# Altium project EMG-Arm_ELC-v1.0.PrjPcb (part 6 of 9)

## Sheet Electrode-Sheet5.SchDoc
size A4; SheetNumber: 7; SheetTotal: 12
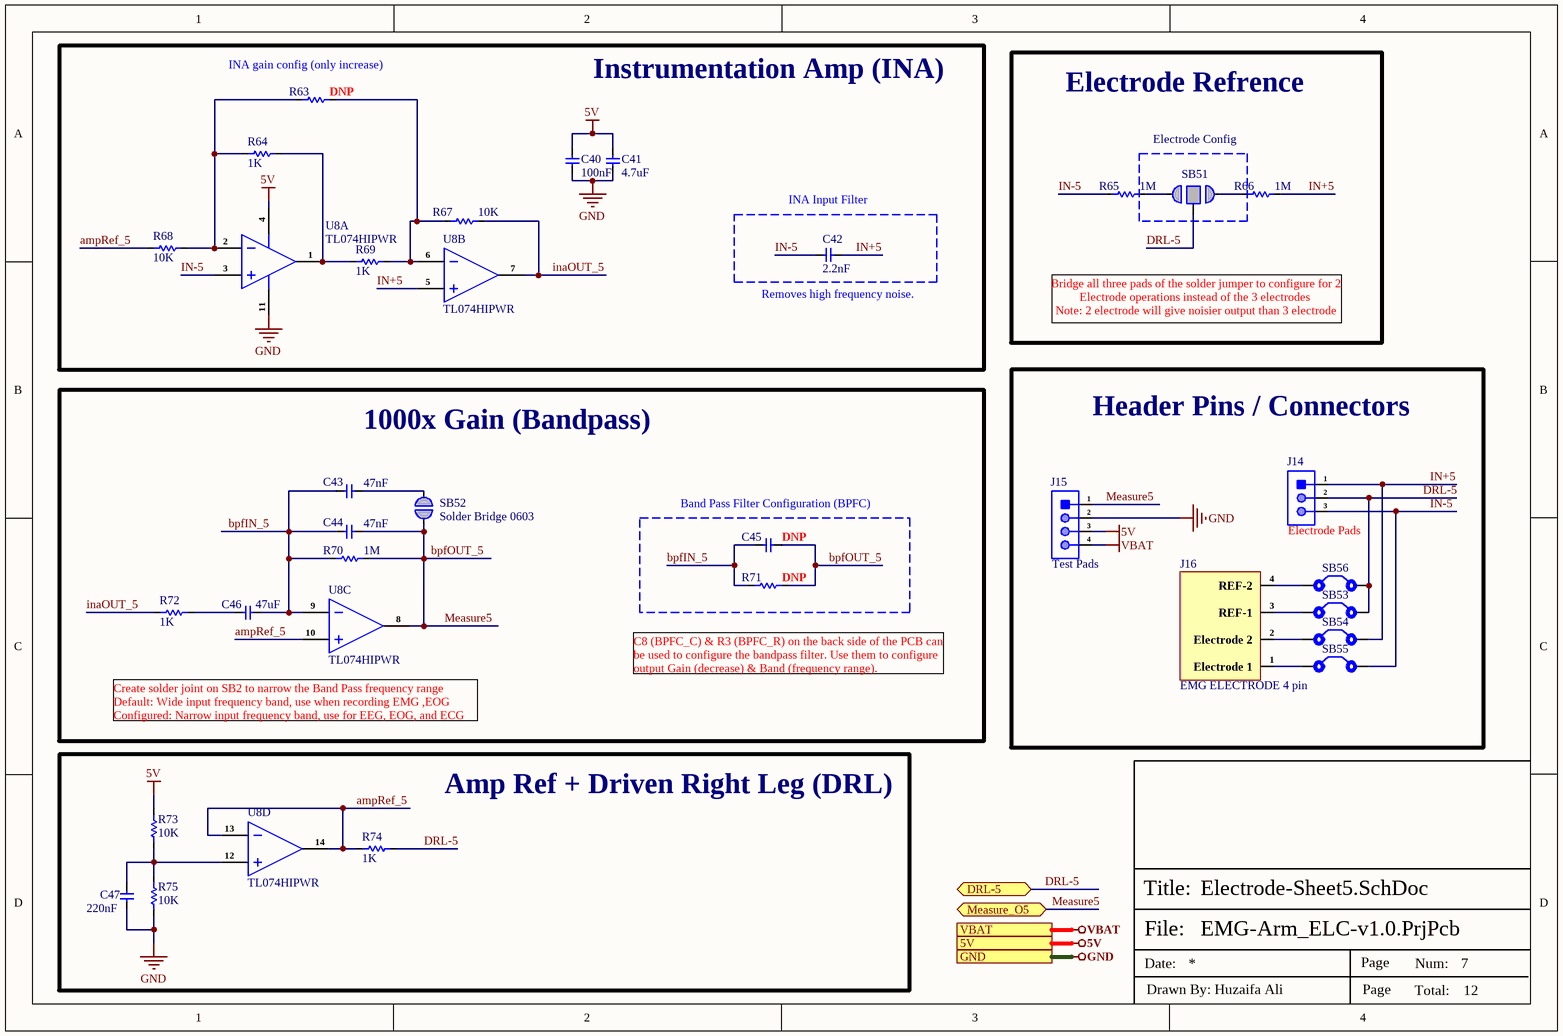
[diagram p8: Electrode-Sheet5.SchDoc]

### Parts
C40  100nF  [cap-0402]
C41  4.7uF  [Cap-0603]
C42  2.2nF  [Cap-0603]
C43  47nF  [Cap-0603]
C44  47nF  [Cap-0603]
C45  DNP  [Cap-0603]
C46  47uF  [Cap-0805]
C47  220nF  [Cap-0603]
J14  Test Pad SMD 3 Pin  [Test Pad (SMD 3 Pin)]  (value not drawn)  (no BOM)
J15  4 Pin SMD Wire Connector  [4 Pin SMD Wire CON.]  (value not drawn)  (no BOM)
J16  EMG ELECTRODE 4 pin  [EMG ELECTRODE 4 pin]  (no BOM)
R63  DNP  [Res-0603]
R64  1K  [Res-0402]
R65  1M  [Res-0402]
R66  1M  [Res-0402]
R67  10K  [Res-0402]
R68  10K  [Res-0402]
R69  1K  [Res-0402]
R70  1M  [Res-0603]
R71  DNP  [Res-0603]
R72  1K  [Res-0402]
R73  10K  [Res-0402]
R74  1K  [Res-0402]
R75  10K  [Res-0402]
SB51  Solder Bridge 3 Pin  [Solder Bridge 3 Pin]  (value not drawn)  (no BOM)
SB52  Solder Bridge 0603  [Solder Bridge]  (no BOM)
SB53  Solder Bridge 0603  [Solder Bridge]  (value not drawn)  (no BOM)
SB54  Solder Bridge 0603  [Solder Bridge]  (value not drawn)  (no BOM)
SB55  Solder Bridge 0603  [Solder Bridge]  (value not drawn)  (no BOM)
SB56  Solder Bridge 0603  [Solder Bridge]  (value not drawn)  (no BOM)
U8  TL074HIPWR  [TSSOP-14]  (parts A,B,C,D of 4)

### Blocks framed on the sheet
Instrumentation Amp (INA): C40 C41 R63 R64 R67-R69 U8
Electrode Refrence: R65 R66
Electrode Config: SB51
INA Input Filter: C42
1000x Gain (Bandpass): C43 C44 C46 R70 R72 SB52 U8
Header Pins / Connectors: J14-J16 SB53-SB56
Band Pass Filter Configuration (BPFC): C45 R71
Amp Ref + Driven Right Leg (DRL): C47 R73-R75 U8

### Ports
5V (see Top-Sheet[3C], Electrode-Sheet1[3D], Electrode-Sheet2[3D], Electrode-Sheet3[3D], Electrode-Sheet4[3D], Electrode-Sheet6[3D], Electrode-Sheet7[3D], Electrode-Sheet8[3D], Opamp-Sheet2[1D], Power-Sheet[1D]), DRL-5 (bidir, see Top-Sheet[4C], Electrode-Sheet1[3D], Electrode-Sheet2[3D], Electrode-Sheet3[3D], Electrode-Sheet4[3D], Electrode-Sheet6[3D], Electrode-Sheet7[3D], Electrode-Sheet8[3D]), GND (see Top-Sheet[3C], Connector-Sheet[1D], Electrode-Sheet1[3D], Electrode-Sheet2[3D], Electrode-Sheet3[3D], Electrode-Sheet4[3D], Electrode-Sheet6[3D], Electrode-Sheet7[3D], Electrode-Sheet8[3D], Opamp-Sheet2[1D], Power-Sheet[1D]), Measure_O5 (bidir, see Top-Sheet[3C]), VBAT (see Top-Sheet[3C], Connector-Sheet[1D], Electrode-Sheet1[3D], Electrode-Sheet2[3D], Electrode-Sheet3[3D], Electrode-Sheet4[3D], Electrode-Sheet6[3D], Electrode-Sheet7[3D], Electrode-Sheet8[3D], Power-Sheet[1D])

### Nets
5V: C40.2 C41.2 J15.3 R73.2 U8.4(VCC+) ; port 5V
GND: C40.1 C41.1 C47.1 J15.2 R75.1 U8.11(VCC-) ; port GND
VBAT: J15.4 ; port VBAT
ampRef_5: R68.2 R74.1 U8.10(3IN+) U8.13(4IN-) U8.14(4OUT)
bpfIN_5: C43.1 C44.1 C45.2 C46.2 R70.1 R71.1 U8.9(3IN-)
bpfOUT_5: C44.2 C45.1 J15.1 R70.2 R71.2 SB52.2 U8.8(3OUT) ; port Measure_O5  [also labelled Measure5]
DRL-5: J14.2 R74.2 SB51.2 SB53.2 SB56.2 ; port DRL-5
IN+5: C42.2 J14.1 R66.2 SB54.2 U8.5(2IN+)
IN-5: C42.1 J14.3 R65.1 SB55.2 U8.3(1IN+)
inaOUT_5: R67.1 R72.1 U8.7(2OUT)
NetC43_2: C43.2 SB52.1
NetC46_1: C46.1 R72.2
NetC47_2: C47.2 R73.1 R75.2 U8.12(4IN+)
NetJ16_1: J16.1(Electrode_1) SB55.1
NetJ16_2: J16.2(Electrode_2) SB54.1
NetJ16_3: J16.3(REF-1) SB53.1
NetJ16_4: J16.4(REF-2) SB56.1
NetR63_1: R63.1 R64.1 R68.1 U8.2(1IN-)
NetR63_2: R63.2 R67.2 R69.2 U8.6(2IN-)
NetR64_2: R64.2 R69.1 U8.1(1OUT)
NetR65_2: R65.2 SB51.1
NetR66_1: R66.1 SB51.3

### Notes on the sheet
- (near R63) INA gain config (only increase)
- (near C42) Removes high frequency noise.
- Bridge all three pads of the solder jumper to configure for 2 Electrode operations instead of the 3 electrodes
  Note: 2 electrode will give noisier output than 3 electrode
- (near J15) Test Pads
- (near J14) Electrode Pads
- (near U8) Create solder joint on SB2 to narrow the Band Pass frequency range
  Default: Wide input frequency band, use when recording EMG ,EOG
  Configured: Narrow input frequency band, use for EEG, EOG, and ECG
- (near R71) C8 (BPFC_C) & R3 (BPFC_R) on the back side of the PCB can be used to configure the bandpass filter. Use them to configure output Gain (decrease) & Band (frequency range).
- File:
- Title:
- Date:
- Page
- Num:
- Total:
- Drawn By: Huzaifa Ali

### Library data of the parts
C40 = C1005X7R1H104KT000F: CAP CER 0.1UF 50V X7R 0402; Manufacturer: TDK; Tolerance: 10%; Voltage: 25V; Item Type: Capacitor; Supplier 1: Avnet; Manufacturer Part Number: C1005X7R1H104KT000F; RoHS: No; Category: Ceramic Capacitors; Dielectric: X7R; Supplier Part Number 1: C1005X7R1H104KT000F; LCSC Part Number: C361198; ComponentLink1Description: LCSC; ComponentLink1URL: https://www.lcsc.com/product-detail/Multilayer-Ceramic-Capacitors-MLCC-SMD-SMT_TDK-C1005X7R1H104KT000F_C361198.html
C41 = C1608X5R1E475KT000E: CAP CER, 4.7 µF, 25 V, 0603; Manufacturer: TDK; Dielectric Material: Ceramic; Tolerance: 10%; Voltage Rating: 25V; Dielectric: X5R; Item Type: Capacitor; Supplier 1: Digi-Key; Manufacturer Part Number: C1608X5R1E475KT000E; RoHS: No; Supplier Part Number 1: 2220Y1000562GCT-ND; Supplier 2: RSComponents; Category: Ceramic Capacitors; Stock 2: 16120; Pricing 2: 100=0.23400, 200=0.21900, 1000=0.20700, 2000=0.18700 (GBP); Mount: Surface Mount; Case/Package: 0603; Weight: 7.1E-05oz; Case Code (Metric): 1608; Case Code (Imperial): 0603; Min Operating Temperature: -55°C; Max Operating Temperature: 85°C; Termination: SMD/SMT; Resistor Type: Ceramic; Packaging: Tape and Reel; Capacitance: 4.7uF; Package Quantity: 4000; Voltage Rating (DC): 25V; Length: 1.6mm; Width: 0.031inch; Height: 0.8mm; Thickness: 0.039inch; Depth: 0.8mm; Lead Free: Lead Free; REACH SVHC: No SVHC; ComponentLink1URL: https://datasheet.ciiva.com/48587/6print-detail-pdf-phplangenpart-noc1608x5r1e475k080acimp-unit-xmhz-48587141.pdf?src-supplier=Onlinecomponents.com; ComponentLink1Description: https://datasheet.ciiva.com/48587/6print-detail-pdf-phplangenpart-noc1608x5r1e475k080acimp-unit-xmhz-48587141.pdf?src-supplier=Onlinecomponents.com; ComponentLink2URL: https://datasheet.ciiva.com/24216/mlcc-commercial-general-en-24216326.pdf?src-supplier=Mouser; ComponentLink2Description: https://datasheet.ciiva.com/24216/mlcc-commercial-general-en-24216326.pdf?src-supplier=Mouser; ComponentLink3URL: https://datasheet.ciiva.com/48671/mlcc-commercial-general-en-48671304.pdf?src-supplier=Avnet; ComponentLink3Description: https://datasheet.ciiva.com/48671/mlcc-commercial-general-en-48671304.pdf?src-supplier=Avnet; Supplier Part Number 2: 9159158P; LCSC Part Number: C76615
C42 = CC0603KRX7R9BB222: CAP CER 2200PF 50V X7R 0603; Manufacturer: Yageo; Tolerance: 10%; Insulation Resistance: 10GR; Dissipation Factor: 2.5%; Item Type: Capacitor; Supplier 1: RSComponents; Manufacturer Part Number: CC0603KRX7R9BB222; RoHS: Yes; Category: Ceramic Capacitors; Stock 1: 1; Pricing 1: 4000=0.00500 (USD); Mount: Surface Mount; Case/Package: 0603; Number of Pins: 2; Case Code (Metric): 1608; Case Code (Imperial): 0603; Min Operating Temperature: -55°C; Max Operating Temperature: 125°C; Capacitance: 2.2nF; Dielectric: X7R; Package Quantity: 1; Voltage Rating: 50V; Packaging: Tape and Reel; Voltage Rating (DC): 50V; Termination: SMD/SMT; Resistor Type: Ceramic; Voltage: 50V; Series: CC; Length: 1.6mm; Width: 0.031inch; Height: 0.8mm; Thickness: 0.035inch; Depth: 0.8mm; Radiation Hardening: No; REACH SVHC: No SVHC; Lead Free: Lead Free; Halogen Free: Halogen Free; RoHS Compliant: Yes; ComponentLink1URL: https://datasheet.ciiva.com/23768/1079489-23768004.pdf?src-supplier=Newark; ComponentLink1Description: https://datasheet.ciiva.com/23768/1079489-23768004.pdf?src-supplier=Newark; ComponentLink2URL: https://datasheet.ciiva.com/11788/0900766b8079c870-11788403.pdf?src-supplier=RSComponents; ComponentLink2Description: https://datasheet.ciiva.com/11788/0900766b8079c870-11788403.pdf?src-supplier=RSComponents; ComponentLink3URL: https://datasheet.ciiva.com/26862/getdatasheetpartid-403587-26862854.pdf?src-supplier=Verical; ComponentLink3Description: https://datasheet.ciiva.com/26862/getdatasheetpartid-403587-26862854.pdf?src-supplier=Verical; ComponentLink4URL: https://datasheet.ciiva.com/8033/70765-8033863.pdf?src-supplier=Element14; ComponentLink4Description: https://datasheet.ciiva.com/8033/70765-8033863.pdf?src-supplier=Element14; ComponentLink5URL: https://datasheet.ciiva.com/7978/1489800-7978172.pdf?src-supplier=Element14; ComponentLink5Description: https://datasheet.ciiva.com/7978/1489800-7978172.pdf?src-supplier=Element14; ComponentLink6URL: https://datasheet.ciiva.com/28450/1489800-28450632.pdf?src-supplier=Element14; ComponentLink6Description: https://datasheet.ciiva.com/28450/1489800-28450632.pdf?src-supplier=Element14; ComponentLink7URL: https://datasheet.ciiva.com/155/mlccorderingcode-155921.pdf?src-supplier=Digi-Key; ComponentLink7Description: https://datasheet.ciiva.com/155/mlccorderingcode-155921.pdf?src-supplier=Digi-Key; ComponentLink8URL: https://datasheet.ciiva.com/155/mlccorderingcode-155920.pdf?src-supplier=Digi-Key; ComponentLink8Description: https://datasheet.ciiva.com/155/mlccorderingcode-155920.pdf?src-supplier=Digi-Key; ComponentLink9URL: https://datasheet.ciiva.com/155/mlccorderingcode-155922.pdf?src-supplier=Digi-Key; ComponentLink9Description: https://datasheet.ciiva.com/155/mlccorderingcode-155922.pdf?src-supplier=Digi-Key; ComponentLink10URL: https://datasheet.ciiva.com/8033/1489800-8033864.pdf?src-supplier=Element14; ComponentLink10Description: https://datasheet.ciiva.com/8033/1489800-8033864.pdf?src-supplier=Element14; ComponentLink11URL: https://datasheet.ciiva.com/8033/1489800-8033862.pdf?src-supplier=Element14; ComponentLink11Description: https://datasheet.ciiva.com/8033/1489800-8033862.pdf?src-supplier=Element14; ComponentLink12URL: https://datasheet.ciiva.com/16625/upy-gphc-x7r-6-3v-to-50v-8-16625531.pdf?src-supplier=Avnet+Europe; ComponentLink12Description: https://datasheet.ciiva.com/16625/upy-gphc-x7r-6-3v-to-50v-8-16625531.pdf?src-supplier=Avnet+Europe; Supplier Part Number 1: 6169509; LCSC Part Number: C107082
C43 C44 = CGA3E2X8R1H473M080AA: CAP CER 0.047UF 50V X8R 0603; Manufacturer: TDK; Tolerance: 20%; Item Type: Capacitor; Supplier 1: Digi-Key; Manufacturer Part Number: CGA3E2X8R1H473M080AA; RoHS: Yes; Category: Ceramic Capacitors; Stock 1: 1279; Pricing 1: 1=0.16000, 10=0.11200, 50=0.06360, 100=0.05260, 500=0.03690, 1000=0.03055 (USD); Mount: Surface Mount; Case/Package: 0603; Case Code (Metric): 1608; Weight: 7.1E-05oz; Case Code (Imperial): 0603; Min Operating Temperature: -55°C; Max Operating Temperature: 150°C; Dielectric: X8R; Voltage Rating (DC): 50V; Package Quantity: 4000; Packaging: Tape and Reel; Capacitance: 47nF; Voltage Rating: 50V; Features: High Temperature; Length: 0.063inch; Width: 0.031inch; Height: 0.8mm; Thickness: 0.035inch; Ratings: AEC-Q200; ComponentLink1URL: http://www.mouser.com/ds/2/400/mlcc_automotive_hightemp_en-520039.pdf?src-supplier=Mouser; ComponentLink1Description: http://www.mouser.com/ds/2/400/mlcc_automotive_hightemp_en-520039.pdf?src-supplier=Mouser; ComponentLink2URL: https://product.tdk.com/info/en/catalog/spec/mlccspec_automotive_hightemp_en.pdf?src-supplier=Digi-Key; ComponentLink2Description: https://product.tdk.com/info/en/catalog/spec/mlccspec_automotive_hightemp_en.pdf?src-supplier=Digi-Key; ComponentLink3URL: http://product.tdk.com/en/catalog/datasheets/mlcc_automotive_hightemp_en.pdf?src-supplier=Avnet; ComponentLink3Description: http://product.tdk.com/en/catalog/datasheets/mlcc_automotive_hightemp_en.pdf?src-supplier=Avnet; Supplier Part Number 1: 445-12603-1-ND; LCSC Part Number: C2172709
C45 = CC0603JRX7R9BB104: Optional
C46 = GRM21BR61A476ME15L: CAP CER 47UF 10V X5R 0805; Manufacturer: Murata; Item Type: Capacitors; Dielectric Material: Ceramic; Material: 4241ConductorMaterial; Tolerance: 20%; Dissipation Factor: 0.035%; Supplier: Future Electronics; LCSC Part Number: C124129; Manufacturer Part Number: GRM21BR61A476ME15L; RoHS: Yes; Stock: 315000; Pricing: 3000=0.161, 6000=0.157, 9000=0.156, 12000=0.154, 15000=0.15 (USD); Mounting Technology: Surface Mount; Case/Package: 0805; Case Code (Metric): 2012; Case Code (Imperial): 0805; Min Operating Temperature: -55°C; Max Operating Temperature: 85°C; Value: 47uF; Packaging: Cut Tape; Dielectric: X5R; Voltage Rating: 10V; Voltage: 10V; Termination: SMD/SMT; Voltage Rating (DC): 10V; Series: GRM; Length: 0.079inch; Width: 0.049inch; Height: 1.25mm; Thickness: 0.057inch; Depth: 1.25mm; Reach SVHC Compliant: No; Lead Free: Lead Free; RoHS Compliant: Yes; ComponentLink1URL: http://www.farnell.com/datasheets/2079183.pdf?src-supplier=Farnell; ComponentLink1Description: http://www.farnell.com/datasheets/2079183.pdf?src-supplier=Farnell; ComponentLink2URL: http://www.farnell.com/datasheets/2079183.pdf?src-supplier=Newark; ComponentLink2Description: http://www.farnell.com/datasheets/2079183.pdf?src-supplier=Newark; ComponentLink3URL: http://www.farnell.com/datasheets/2079183.pdf?src-supplier=Element14; ComponentLink3Description: http://www.farnell.com/datasheets/2079183.pdf?src-supplier=Element14; ComponentLink4URL: https://datasheet.octopart.com/GRM21BR61A476ME15L-Murata-datasheet-66077109.pdf?src-supplier=Element14; ComponentLink4Description: https://datasheet.octopart.com/GRM21BR61A476ME15L-Murata-datasheet-66077109.pdf?src-supplier=Element14; ComponentLink5URL: http://search.murata.co.jp/Ceramy/image/img/A01X/G101/ENG/GRM21BR61A476ME15-01.pdf?src-supplier=Digikey; ComponentLink5Description: http://search.murata.co.jp/Ceramy/image/img/A01X/G101/ENG/GRM21BR61A476ME15-01.pdf?src-supplier=Digikey; ComponentLink6URL: https://search.murata.co.jp/Ceramy/image/img/A01X/G101/ENG/GRM21BR61A476ME15-01.pdf?src-supplier=Digikey; ComponentLink6Description: https://search.murata.co.jp/Ceramy/image/img/A01X/G101/ENG/GRM21BR61A476ME15-01.pdf?src-supplier=Digikey; ComponentLink7URL: http://psearch.en.murata.com/capacitor/product/GRM21BR61A476ME15%23.pdf?src-supplier=Avnet; ComponentLink7Description: http://psearch.en.murata.com/capacitor/product/GRM21BR61A476ME15%23.pdf?src-supplier=Avnet
C47 = CC0603KRX7R8BB224: CAP CER 0.22UF 25V X7R 0603; Manufacturer: Yageo; Item Type: Capacitors; Material: 4241ConductorMaterial; Supplier: Digikey; LCSC Part Number: C106857; Manufacturer Part Number: CC0603KRX7R8BB224; RoHS: Yes; Stock: 76385; Pricing: 1=0.13, 10=0.07, 50=0.0488, 100=0.0422, 500=0.03094, 1000=0.02743 (USD); Pins: 2NUMBER; Lead Free: 5697LeadFree; Halogen Free: 5694HalogenFree; ComponentLink1URL: http://www.mouser.com/ds/2/447/Yageo_UPY-GP_NP0_16V-to-50V_9-358835.pdf?src-supplier=Mouser; ComponentLink1Description: http://www.mouser.com/ds/2/447/Yageo_UPY-GP_NP0_16V-to-50V_9-358835.pdf?src-supplier=Mouser; ComponentLink2URL: https://datasheet.octopart.com/CC0603KRX7R8BB224-Yageo-datasheet-140260305.pdf?src-supplier=Newark; ComponentLink2Description: https://datasheet.octopart.com/CC0603KRX7R8BB224-Yageo-datasheet-140260305.pdf?src-supplier=Newark; ComponentLink3URL: https://datasheet.octopart.com/CC0603KRX7R8BB224-Yageo-datasheet-181968713.pdf?src-supplier=Element14; ComponentLink3Description: https://datasheet.octopart.com/CC0603KRX7R8BB224-Yageo-datasheet-181968713.pdf?src-supplier=Element14; ComponentLink4URL: https://datasheet.octopart.com/CC0603KRX7R8BB224-Yageo-datasheet-181968713.pdf?src-supplier=Newark; ComponentLink4Description: https://datasheet.octopart.com/CC0603KRX7R8BB224-Yageo-datasheet-181968713.pdf?src-supplier=Newark; ComponentLink5URL: https://datasheet.octopart.com/CC0603KRX7R8BB224-Yageo-datasheet-147453679.pdf?src-supplier=Farnell; ComponentLink5Description: https://datasheet.octopart.com/CC0603KRX7R8BB224-Yageo-datasheet-147453679.pdf?src-supplier=Farnell; ComponentLink6URL: https://datasheet.octopart.com/CC0603KRX7R8BB224-Yageo-datasheet-27626582.pdf?src-supplier=Future+Electronics; ComponentLink6Description: https://datasheet.octopart.com/CC0603KRX7R8BB224-Yageo-datasheet-27626582.pdf?src-supplier=Future+Electronics; ComponentLink7URL: http://www.yageo.com/documents/recent/UPY-GPHC_X7R_6.3V-to-50V_8.pdf?src-supplier=Avnet; ComponentLink7Description: http://www.yageo.com/documents/recent/UPY-GPHC_X7R_6.3V-to-50V_8.pdf?src-supplier=Avnet; ComponentLink8URL: http://www.yageo.com/documents/recent/UPY-GPHC_X7R_6.3V-to-50V_18.pdf?src-supplier=Digikey; ComponentLink8Description: http://www.yageo.com/documents/recent/UPY-GPHC_X7R_6.3V-to-50V_18.pdf?src-supplier=Digikey; ComponentLink9URL: https://datasheet.octopart.com/CC0603KRX7R8BB224-Yageo-datasheet-151948686.pdf?src-supplier=TME; ComponentLink9Description: https://datasheet.octopart.com/CC0603KRX7R8BB224-Yageo-datasheet-151948686.pdf?src-supplier=TME
J14 = Test Pad SMD 3 Pin: Test Pad
J15 = 4 Pin SMD Wire Connector: Wire Connecting Pads; Item Type: SMD Pads; Manufacturer Part Number: 4 Pin SMD Wire Connector
J16 = EMG ELECTRODE 4 pin: Sensor Connecting Pads
R63 R71 = RC0603FR-071KL: Optional
R64 R69 R72 R74 = RC0402FR-071KL: RES 1K OHM 1% 1/16W 0402; Manufacturer: Yageo; Resistance: 1kR; Temperature Coefficient: 100ppm/°C; Voltage Rating (DC): 50V; Power Rating: 62.5mW; Max Power Dissipation: 63mW; Item Type: Resistor; Supplier 1: Avnet; Manufacturer Part Number: RC0402FR-071KL; RoHS: Yes; Category: Chip SMD Resistors; Stock 1: 13030000; Pricing 1: 10000=0.00085, 20000=0.00087, 40000=0.00084, 60000=0.00083, 80000=0.00079, 100000=0.00078, 1000000=0.00076 (USD); Case/Package: 0402; Number of Pins: 2; Case Code (Imperial): 0402; Case Code (Metric): 1005; Size Code: 0402; Min Operating Temperature: -55°C; Max Operating Temperature: 155°C; Resistor Type: Thick Film; Tolerance: 1%; Packaging: Tape and Reel; Voltage Rating: 50V; Termination: SMD/SMT; Features: Moisture Resistant; Series: RC; Number of Terminations: 2; Resistance Tolerance: 1%; Construction: Rectangular; Technology: THICK FILM; Length: 1mm; Width: 0.5mm; Height: 0.32mm; Depth: 0.5mm; Reach SVHC Compliant: Yes; Lead Free: Lead Free; RoHS Compliant: Yes; Military Standard: Not; ComponentLink1URL: https://datasheet.ciiva.com/11819/0900766b80c66297-11819477.pdf?src-supplier=RSComponents; ComponentLink1Description: https://datasheet.ciiva.com/11819/0900766b80c66297-11819477.pdf?src-supplier=RSComponents; ComponentLink2URL: https://datasheet.ciiva.com/7983/1018594-7983502.pdf?src-supplier=Element14; ComponentLink2Description: https://datasheet.ciiva.com/7983/1018594-7983502.pdf?src-supplier=Element14; ComponentLink3URL: https://datasheet.ciiva.com/22747/1018594-22747513.pdf?src-supplier=Element14; ComponentLink3Description: https://datasheet.ciiva.com/22747/1018594-22747513.pdf?src-supplier=Element14; ComponentLink4URL: https://datasheet.ciiva.com/12666/pyu-rc0402-51-rohs-l-6-r-12666741.pdf?src-supplier=Mouser; ComponentLink4Description: https://datasheet.ciiva.com/12666/pyu-rc0402-51-rohs-l-6-r-12666741.pdf?src-supplier=Mouser; ComponentLink5URL: https://datasheet.ciiva.com/7849/1018594-7849869.pdf?src-supplier=Element14; ComponentLink5Description: https://datasheet.ciiva.com/7849/1018594-7849869.pdf?src-supplier=Element14; ComponentLink6URL: https://datasheet.ciiva.com/7849/1018594-7849871.pdf?src-supplier=Element14; ComponentLink6Description: https://datasheet.ciiva.com/7849/1018594-7849871.pdf?src-supplier=Element14; ComponentLink7URL: https://datasheet.ciiva.com/17063/pyu-rc0402-51-rohs-l-6-r-17063193.pdf?src-supplier=Future+Electronics; ComponentLink7Description: https://datasheet.ciiva.com/17063/pyu-rc0402-51-rohs-l-6-r-17063193.pdf?src-supplier=Future+Electronics; Supplier Part Number 1: RC0402FR-071KL; LCSC Part Number: C106235
R65 R66 = RC0402FR-071ML: RES 1M OHM 1% 1/16W 0402; Manufacturer: Yageo; Voltage Rating: 50V; Power Rating: 63mW; Temperature Coefficient: 100ppm/°C; Item Type: Resistor; Value: 1MR; Manufacturer Part Number: RC0402FR-071ML; Case/Package: 0402; Case Code (Imperial): 0402; Case Code (Metric): 1005; Min Operating Temperature: -55°C; Max Operating Temperature: 155°C; Tolerance: 1%; Packaging: Tape and Reel; Termination: SMD/SMT; Military Standard: Not; Length: 1mm; Height: 0.32mm; Depth: 0.5mm; Lead Free: 5697LeadFree; ComponentLink1URL: https://datasheet.ciiva.com/11808/0900766b80c66297-11808125.pdf?src-supplier=Rs; ComponentLink1Description: https://datasheet.ciiva.com/11808/0900766b80c66297-11808125.pdf?src-supplier=Rs; ComponentLink2URL: https://datasheet.ciiva.com/46394/1018594-46394951.pdf?src-supplier=Element14; ComponentLink2Description: https://datasheet.ciiva.com/46394/1018594-46394951.pdf?src-supplier=Element14; ComponentLink3URL: https://datasheet.ciiva.com/7849/1018594-7849883.pdf?src-supplier=Element14; ComponentLink3Description: https://datasheet.ciiva.com/7849/1018594-7849883.pdf?src-supplier=Element14; LCSC Part Number: C138033; Supplier: Digikey; Supplier Part Number: 311-1.00MLRCT-ND; RoHS: Yes; Category: Chip SMD Resistors; Stock: 6516; Pricing: 1=0.1, 10=0.015, 50=0.0088, 100=0.0073, 500=0.00488, 1000=0.00417, 5000=0.00297 (USD); Resistor Type: Thick Film; Features: Moisture Resistant; Series: RC; Max Power Dissipation: 63mW; Number of Terminations: 2; Resistance Tolerance: 1%; Construction: Rectangular; Technology: THICK FILM; Voltage Rating (AC): 50V; RoHS Compliant: Yes; Reach SVHC Compliant: Unknown; ComponentLink4URL: https://datasheet.ciiva.com/7849/1018594-7849882.pdf?src-supplier=Element14; ComponentLink4Description: https://datasheet.ciiva.com/7849/1018594-7849882.pdf?src-supplier=Element14; ComponentLink5URL: https://datasheet.ciiva.com/16741/pyu-rc0402-51-rohs-l-6-r-16741081.pdf?src-supplier=Future+Electronics; ComponentLink5Description: https://datasheet.ciiva.com/16741/pyu-rc0402-51-rohs-l-6-r-16741081.pdf?src-supplier=Future+Electronics
R67 R68 R73 R75 = RC0402FR-0710KL: RES 10K OHM 1% 1/16W 0402; Manufacturer: Yageo; Resistance: 10kR; Voltage Rating (DC): 50V; Temperature Coefficient: 100ppm/°C; Power Rating: 62.5mW; Max Power Dissipation: 63mW; Item Type: Resistor; Supplier 1: Mouser; Manufacturer Part Number: RC0402FR-0710KL; RoHS: Yes; Category: Chip SMD Resistors; Stock 1: 18648329; Pricing 1: 1=0.10000, 10=0.01400, 50=0.01400, 100=0.00500, 1000=0.00300, 10000=0.00200 (USD); Case/Package: 0402; Number of Pins: 2; Case Code (Imperial): 0402; Case Code (Metric): 1005; Min Operating Temperature: -55°C; Max Operating Temperature: 155°C; Resistor Type: Thick Film; Tolerance: 1%; Packaging: Tape and Reel; Voltage Rating: 50V; Termination: SMD/SMT; Working Voltage: 50V; Number of Terminations: 2; Features: Moisture Resistant; Series: RC; Resistance Tolerance: 1%; Construction: Rectangular; Length: 1mm; Width: 0.5mm; Height: 0.32mm; Depth: 0.5mm; Lead Pitch: 0.2mm; REACH SVHC: No SVHC; Lead Free: Lead Free; RoHS Compliant: Yes; Military Standard: Not; ComponentLink1URL: https://datasheet.ciiva.com/7660/38568-7660787.pdf?src-supplier=Element14; ComponentLink1Description: https://datasheet.ciiva.com/7660/38568-7660787.pdf?src-supplier=Element14; ComponentLink2URL: https://datasheet.ciiva.com/7849/1686128-7849814.pdf?src-supplier=Element14; ComponentLink2Description: https://datasheet.ciiva.com/7849/1686128-7849814.pdf?src-supplier=Element14; ComponentLink3URL: https://datasheet.ciiva.com/7983/1018594-7983486.pdf?src-supplier=Element14; ComponentLink3Description: https://datasheet.ciiva.com/7983/1018594-7983486.pdf?src-supplier=Element14; ComponentLink4URL: https://datasheet.ciiva.com/22747/1018594-22747512.pdf?src-supplier=Element14; ComponentLink4Description: https://datasheet.ciiva.com/22747/1018594-22747512.pdf?src-supplier=Element14; ComponentLink5URL: https://datasheet.ciiva.com/12667/pyu-rc0402-51-rohs-l-6-r-12667067.pdf?src-supplier=Mouser; ComponentLink5Description: https://datasheet.ciiva.com/12667/pyu-rc0402-51-rohs-l-6-r-12667067.pdf?src-supplier=Mouser; ComponentLink6URL: https://datasheet.ciiva.com/7849/1784430-7849813.pdf?src-supplier=Element14; ComponentLink6Description: https://datasheet.ciiva.com/7849/1784430-7849813.pdf?src-supplier=Element14; ComponentLink7URL: https://datasheet.ciiva.com/7849/1784430-7849815.pdf?src-supplier=Element14; ComponentLink7Description: https://datasheet.ciiva.com/7849/1784430-7849815.pdf?src-supplier=Element14; Supplier Part Number 1: 603-RC0402FR-0710KL; LCSC Part Number: C60490
R70 = RC0603FR-071ML: RES SMD 1M OHM 1% 1/10W 0603; Manufacturer: Yageo; Voltage Rating: 50V; Power Rating: 100mW; Temperature Coefficient: 100ppm/°C; Item Type: Resistor; Resistance: 1MR; Manufacturer Part Number: RC0603FR-071ML; Case/Package: 0603; Case Code (Imperial): 0603; Case Code (Metric): 1608; Min Operating Temperature: -55°C; Max Operating Temperature: 155°C; Tolerance: 1%; Packaging: Tape and Reel; Termination: SMD/SMT; Military Standard: Not; Length: 1.6mm; Height: 0.45mm; Depth: 0.8mm; Lead Free: Lead Free; ComponentLink1URL: http://www.farnell.com/datasheets/2167052.pdf?src-supplier=Mouser; ComponentLink1Description: http://www.farnell.com/datasheets/2167052.pdf?src-supplier=Mouser; ComponentLink2URL: http://www.farnell.com/datasheets/2167052.pdf?src-supplier=Element14; ComponentLink2Description: http://www.farnell.com/datasheets/2167052.pdf?src-supplier=Element14; ComponentLink3URL: http://documents.rs-components.com/techlib://itc_doclist_GB.htm?stockno=5048956&src-supplier=RSComponents; ComponentLink3Description: http://documents.rs-components.com/techlib://itc_doclist_GB.htm?stockno=5048956&src-supplier=RSComponents; LCSC Part Number: C105578; Supplier 1: Digi-Key; Stock 1: 3824601; Pricing 1: 1=0.1, 10=0.023, 100=0.0094, 1000=0.00421, 2500=0.00366 (USD); Number of Pins: 2; Voltage Rating (DC): 50V; Package Quantity: 5000; Composition: Thick Film; Width: 0.8mm; REACH SVHC: No SVHC; Supplier Part Number 1: 311-1.00MHRDKR-ND
SB51 = Solder Bridge 3 Pin: Solder Bridge ON; Manufacturer Part Number: Solder Bridge; Item Type: Solder Bridge
SB52-SB56 = Solder Bridge 0603: Solder Bridge ON; Manufacturer Part Number: Solder Bridge; Item Type: Solder Bridge
U8 = TL074HIPWR: IC OPAMP JFET 4 CIRCUIT 14TSSOP; Manufacturer: Texas Instruments; Supplier: Mouser; LCSC Part Number: C4370424; Manufacturer Part Number: TL074HIPWR; RoHS: No; Item Type: IC; Stock: 67959; Pricing: 1=0.26, 10=0.156, 50=0.156, 100=0.117, 1000=0.112, 10000=0.101 (USD); Case/Package: 71Case; Pins: 14NUMBER; Length: 5mm; Width: 4.4mm; Height: 1.2mm; Thickness: 1mm